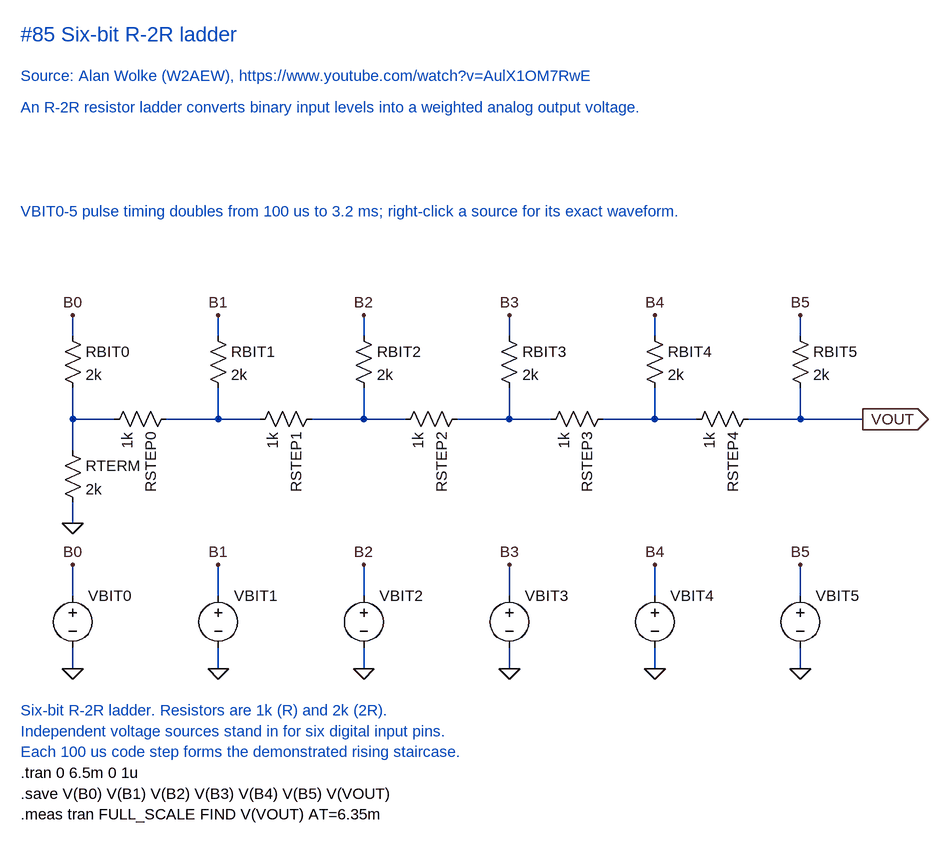
[diagram p0: schematic Six-bit R-2R ladder.asc]
Six-bit R-2R ladder.asc, the LTspice schematic file:
Version 4.1
SHEET 1 1680 800
WIRE 160 0 160 32
WIRE 160 112 160 160
FLAG 160 0 B0
WIRE 160 160 160 208
WIRE 384 0 384 32
WIRE 384 112 384 160
FLAG 384 0 B1
WIRE 304 160 384 160
WIRE 160 160 224 160
WIRE 608 0 608 32
WIRE 608 112 608 160
FLAG 608 0 B2
WIRE 528 160 608 160
WIRE 384 160 448 160
WIRE 832 0 832 32
WIRE 832 112 832 160
FLAG 832 0 B3
WIRE 752 160 832 160
WIRE 608 160 672 160
WIRE 1056 0 1056 32
WIRE 1056 112 1056 160
FLAG 1056 0 B4
WIRE 976 160 1056 160
WIRE 832 160 896 160
WIRE 1280 0 1280 32
WIRE 1280 112 1280 160
FLAG 1280 0 B5
WIRE 1200 160 1280 160
WIRE 1056 160 1120 160
WIRE 160 288 160 320
FLAG 160 320 0
WIRE 1280 160 1376 160
FLAG 1376 160 VOUT
IOPIN 1376 160 Out
WIRE 160 384 160 432
WIRE 160 512 160 544
FLAG 160 384 B0
FLAG 160 544 0
WIRE 384 384 384 432
WIRE 384 512 384 544
FLAG 384 384 B1
FLAG 384 544 0
WIRE 608 384 608 432
WIRE 608 512 608 544
FLAG 608 384 B2
FLAG 608 544 0
WIRE 832 384 832 432
WIRE 832 512 832 544
FLAG 832 384 B3
FLAG 832 544 0
WIRE 1056 384 1056 432
WIRE 1056 512 1056 544
FLAG 1056 384 B4
FLAG 1056 544 0
WIRE 1280 384 1280 432
WIRE 1280 512 1280 544
FLAG 1280 384 B5
FLAG 1280 544 0
SYMBOL res 144 16 R0
SYMATTR InstName RBIT0
SYMATTR Value 2k
SYMBOL res 368 16 R0
SYMATTR InstName RBIT1
SYMATTR Value 2k
SYMBOL res 592 16 R0
SYMATTR InstName RBIT2
SYMATTR Value 2k
SYMBOL res 816 16 R0
SYMATTR InstName RBIT3
SYMATTR Value 2k
SYMBOL res 1040 16 R0
SYMATTR InstName RBIT4
SYMATTR Value 2k
SYMBOL res 1264 16 R0
SYMATTR InstName RBIT5
SYMATTR Value 2k
SYMBOL res 320 144 R90
SYMATTR InstName RSTEP0
SYMATTR Value 1k
SYMBOL res 544 144 R90
SYMATTR InstName RSTEP1
SYMATTR Value 1k
SYMBOL res 768 144 R90
SYMATTR InstName RSTEP2
SYMATTR Value 1k
SYMBOL res 992 144 R90
SYMATTR InstName RSTEP3
SYMATTR Value 1k
SYMBOL res 1216 144 R90
SYMATTR InstName RSTEP4
SYMATTR Value 1k
SYMBOL res 144 192 R0
SYMATTR InstName RTERM
SYMATTR Value 2k
SYMBOL voltage 160 416 R0
WINDOW 3 0 0 Invisible 2
SYMATTR InstName VBIT0
SYMATTR Value PULSE(0 3.3 100u 1n 1n 100u 200u)
SYMBOL voltage 384 416 R0
WINDOW 3 0 0 Invisible 2
SYMATTR InstName VBIT1
SYMATTR Value PULSE(0 3.3 200u 1n 1n 200u 400u)
SYMBOL voltage 608 416 R0
WINDOW 3 0 0 Invisible 2
SYMATTR InstName VBIT2
SYMATTR Value PULSE(0 3.3 400u 1n 1n 400u 800u)
SYMBOL voltage 832 416 R0
WINDOW 3 0 0 Invisible 2
SYMATTR InstName VBIT3
SYMATTR Value PULSE(0 3.3 800u 1n 1n 800u 1600u)
SYMBOL voltage 1056 416 R0
WINDOW 3 0 0 Invisible 2
SYMATTR InstName VBIT4
SYMATTR Value PULSE(0 3.3 1600u 1n 1n 1600u 3200u)
SYMBOL voltage 1280 416 R0
WINDOW 3 0 0 Invisible 2
SYMATTR InstName VBIT5
SYMATTR Value PULSE(0 3.3 3200u 1n 1n 3200u 6400u)
TEXT 80 608 Left 2 ;Six-bit R-2R ladder. Resistors are 1k (R) and 2k (2R).
TEXT 80 640 Left 2 ;Independent voltage sources stand in for six digital input pins.
TEXT 80 672 Left 2 ;Each 100 us code step forms the demonstrated rising staircase.
TEXT 80 704 Left 2 !.tran 0 6.5m 0 1u
TEXT 80 736 Left 2 !.save V(B0) V(B1) V(B2) V(B3) V(B4) V(B5) V(VOUT)
TEXT 80 768 Left 2 !.meas tran FULL_SCALE FIND V(VOUT) AT=6.35m
TEXT 80 -160 Left 2 ;VBIT0-5 pulse timing doubles from 100 us to 3.2 ms; right-click a source for its exact waveform.
TEXT 80 -432 Left 3 ;#85 Six-bit R-2R ladder
TEXT 80 -368 Left 2 ;Source: Alan Wolke (W2AEW), https://www.youtube.com/watch?v=AulX1OM7RwE
TEXT 80 -320 Left 2 ;An R-2R resistor ladder converts binary input levels into a weighted analog output voltage.

The netlist it stands for:
* Six-bit R-2R ladder.asc
RBIT0 B0 N001 2k
RBIT1 B1 N002 2k
RBIT2 B2 N003 2k
RBIT3 B3 N004 2k
RBIT4 B4 N005 2k
RBIT5 B5 VOUT 2k
RSTEP0 N002 N001 1k
RSTEP1 N003 N002 1k
RSTEP2 N004 N003 1k
RSTEP3 N005 N004 1k
RSTEP4 VOUT N005 1k
RTERM N001 0 2k
VBIT0 B0 0 PULSE(0 3.3 100u 1n 1n 100u 200u)
VBIT1 B1 0 PULSE(0 3.3 200u 1n 1n 200u 400u)
VBIT2 B2 0 PULSE(0 3.3 400u 1n 1n 400u 800u)
VBIT3 B3 0 PULSE(0 3.3 800u 1n 1n 800u 1600u)
VBIT4 B4 0 PULSE(0 3.3 1600u 1n 1n 1600u 3200u)
VBIT5 B5 0 PULSE(0 3.3 3200u 1n 1n 3200u 6400u)
* Six-bit R-2R ladder. Resistors are 1k (R) and 2k (2R).
* Independent voltage sources stand in for six digital input pins.
* Each 100 us code step forms the demonstrated rising staircase.
.tran 0 6.5m 0 1u
.save V(B0) V(B1) V(B2) V(B3) V(B4) V(B5) V(VOUT)
.meas tran FULL_SCALE FIND V(VOUT) AT=6.35m
* VBIT0-5 pulse timing doubles from 100 us to 3.2 ms; right-click a source for its exact waveform.
* #85 Six-bit R-2R ladder
* Source: Alan Wolke (W2AEW), https://www.youtube.com/watch?v=AulX1OM7RwE
* An R-2R resistor ladder converts binary input levels into a weighted analog output voltage.
.backanno
.end